# Altium schematic sheet Power.SchDoc
size A4; SheetNumber: 3; SheetTotal: 3
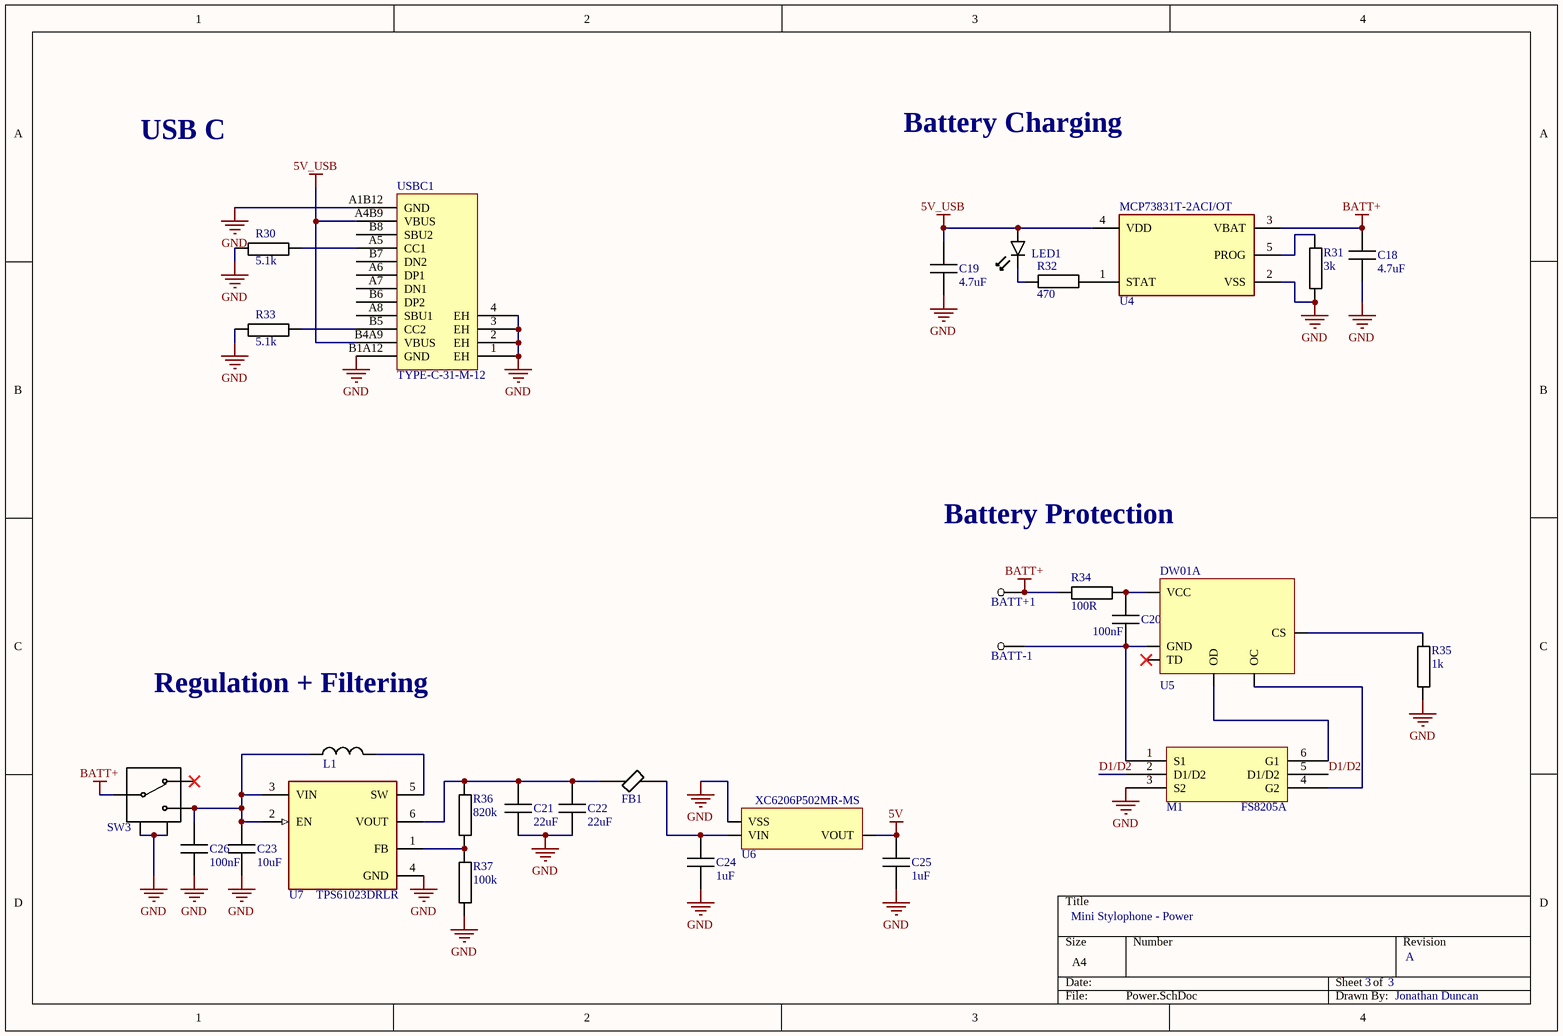
[diagram p0: Power.SchDoc]

## Parts
BATT+1  THT 100mil pad  [THT 100mil pad-Footprint-1]  (value not drawn)  (no BOM)
BATT-1  THT 100mil pad  [THT 100mil pad-Footprint-1]  (value not drawn)  (no BOM)
C18  value 4.7uF  [FP-CC0603-DA-IPC_B]  (hidden comment: Cap 4.7uF 0603)
C19  value 4.7uF  [FP-CC0603-DA-IPC_B]  (hidden comment: Cap 4.7uF 0603)
C20  value 100nF  [FP-CC0603-DA-IPC_B]  (hidden comment: Cap 100nF 0603)
C21  value 22uF  [FP-CC0603-DA-IPC_B]  (hidden comment: Cap 22uF 0603)
C22  value 22uF  [FP-CC0603-DA-IPC_B]  (hidden comment: Cap 22uF 0603)
C23  value 10uF  [FP-CC0603-DA-IPC_B]  (hidden comment: Cap 10uF 0603)
C24  value 1uF  [FP-CC0603-DA-IPC_B]  (hidden comment: Cap 1uF 0603)
C25  value 1uF  [FP-CC0603-DA-IPC_B]  (hidden comment: Cap 1uF 0603)
C26  value 100nF  [FP-CC0603-DA-IPC_B]  (hidden comment: Cap 100nF 0603)
FB1  BLM21AG601SN1D  [FP-BLM21-0_2-t0_85-e0_5-IPC_B]  (value not drawn)
L1  FWP252012P-1R0ML  [INDC2520X120N]  (value not drawn)
LED1  XL-1608SURC-06  [DIOC1608X60N]  (value not drawn)
M1  FS8205A  [SOT95P280X125-6N]
R30  value 5.1k  [FP-RC0603-0_55-IPC_B]  (hidden comment: Res 5k1 0603)
R31  value 3k  [FP-RC0603-0_55-IPC_B]  (hidden comment: Res 3k 0603)
R32  value 470  [FP-RC0603-0_55-IPC_B]  (hidden comment: Res 470 0603)
R33  value 5.1k  [FP-RC0603-0_55-IPC_B]  (hidden comment: Res 5k1 0603)
R34  value 100R  [FP-RC0603-0_55-IPC_B]  (hidden comment: Res 100R 0603)
R35  value 1k  [FP-RC0603-0_55-IPC_B]  (hidden comment: Res 1k 0603)
R36  value 820k  [FP-RC0603-0_55-IPC_B]  (hidden comment: Res 820k 0603)
R37  value 100k  [FP-RC0603-0_55-IPC_B]  (hidden comment: Res 100k 0603)
SW3  SS12D07VG4 087  [SS12D07VG4 087-Footprint-1]  (value not drawn)
U4  MCP73831T-2ACI/OT  [FP-C04-091-OT-IPC_B]
U5  DW01A  [SOT95P280X120-6N]
U6  XC6206P502MR-MS  [SOT95P240X115-3N]
U7  TPS61023DRLR  [FP-DRL0006A-MFG]
USBC1  TYPE-C-31-M-12  [TYPE-C-31-M-12-Footprint-1]

## Nets
5V: C25.2 U6.3(VOUT)
5V_USB: C19.2 LED1.2 U4.4(VDD) USBC1.A4B9(VBUS) USBC1.B4A9(VBUS)
BATT+: BATT+1.1 C18.2 R34.1 SW3.2 U4.3(VBAT)
GND: C18.1 C19.1 C21.1 C22.1 C23.1 C24.1 C25.1 C26.1 M1.3(S2) R30.1 R31.1 R33.1 R35.1 R37.1 SW3.4 SW3.5 U4.2(VSS) U6.1(VSS) U7.4(GND) USBC1.1(EH) USBC1.2(EH) USBC1.3(EH) USBC1.4(EH) USBC1.A1B12(GND) USBC1.B1A12(GND)
D1/D2: M1.2(D1/D2) M1.5(D1/D2)
NetBATT-1_1: BATT-1.1 C20.1 M1.1(S1) U5.6(GND)
NetC20_2: C20.2 R34.2 U5.5(VCC)
NetC21_2: C21.2 C22.2 FB1.1 R36.2 U7.6(VOUT)
NetC23_2: C23.2 C26.2 L1.1 SW3.3 U7.2(EN) U7.3(VIN)
NetC24_2: C24.2 FB1.2 U6.2(VIN)
NetL1_2: L1.2 U7.5(SW)
NetLED1_1: LED1.1 R32.2
NetM1_4: M1.4(G2) U5.3(OC)
NetM1_6: M1.6(G1) U5.1(OD)
NetR30_2: R30.2 USBC1.A5(CC1)
NetR31_2: R31.2 U4.5(PROG)
NetR32_1: R32.1 U4.1(STAT)
NetR33_2: R33.2 USBC1.B5(CC2)
NetR35_2: R35.2 U5.2(CS)
NetR36_1: R36.1 R37.2 U7.1(FB)

Not connected (* = marked no-connect by the designer): SW3 1*; U5 4(TD)*; USBC1 A6(DP1) A7(DN1) A8(SBU1) B6(DP2) B7(DN2) B8(SBU2)

## Notes on the sheet
- USB C
- Battery Charging
- Battery Protection
- Regulation + Filtering
- Mini Stylophone - Power
- 3
- A
- Jonathan Duncan

## Library data of the parts
BATT+1 BATT-1 = CMP-00020-1: 40mil hole, 100mil pad THT; Hole Diameter: 40mil; Pad Diameter: 100mil
C18 C19 = CMP-001-00004-1: 4.7uF 16V 10% X5R 0603 SMD Capacitor; Voltage Rating: 16V; Tolerance: 10%; Temperature Coefficient: X5R; Mounting Technology: SMT; Case/Package: 0603
C20 C26 = CMP-00006-5: 100nF 50V 10% X7R 0603 SMD Capacitor Decoupling; Temperature Coefficient: X7R; Mounting Technology: SMT; Tolerance: 10%; Case/Package: 0603; Voltage Rating: 50V
C21 C22 = CMP-001-00003-1: 22uF 6.3V 20% X5R 0603 SMD Capacitor; Case/Package: 0603; Mounting Technology: SMT; Voltage Rating: 6.3V; Tolerance: 20%; Temperature Coefficient: X5R
C23 = CMP-001-00002-1: 10uF 6.3V 10% X5R 0603 SMD Capacitor; Mounting Technology: SMT; Voltage Rating: 6.3V; Case/Package: 0603; Tolerance: 10%; Temperature Coefficient: X5R
C24 C25 = CMP-001-00001-2: 1uF 25V 10% X5R 0603 SMD Capacitor; Temperature Coefficient: X5R; Case/Package: 0603; Voltage Rating: 25V; Tolerance: 10%; Mounting Technology: SMT
FB1 = CMP-00030-2: Ferrite Beads Multi-Layer 600Ohm 25% 100MHz 600mA 210mOhm DCR 0805 T/R; Impedance: 600Ω; Case/Package: 0805; Case Code (Imperial): 0805
L1 = CMP-00031-3: 1MHz ¡À20% 41m¦¸ 3.5A 1¦ÌH 1008 2.5mm(Length)*1.2mm(height)
LED1 = CMP-00029-2: 120¡ã 330mcd 1.6*0.8*0.6 mm colourless£¬red£¬transparent 0603
M1 = CMP-00026-3: 1.5W 10V 1.2V 5.7NC@ 10V 1INDIVIDUALNCHANNEL 20V 19.5M¦¸@ 4.5V, 3A 6A 466PF@10V SOT-23-6
R30 R33 = CMP-009-00005-1: 5.1k 1% 100mW 0603 SMD Resistor; Power Rating: 100mW; Mounting Technology: SMT; Tolerance: 1%; Case/Package: 0603
R31 = CMP-009-00025-1: 3k 1% 100mW 0603 SMD Resistor; Tolerance: 1%; Mounting Technology: SMT; Power Rating: 100mW; Case/Package: 0603
R32 = CMP-00011-2: 470 1% 100mW 0603 SMD Resistor; Case/Package: 0603; Power Rating: 100mW; Tolerance: 1%; Mounting Technology: SMT
R34 = CMP-009-00020-1: 100R 1% 100mW 0603 SMD Resistor; Case/Package: 0603; Tolerance: 1%; Mounting Technology: SMT; Power Rating: 100mW
R35 = CMP-009-00023-1: 1k 1% 100mW 0603 SMD Resistor; Tolerance: 1%; Power Rating: 100mW; Mounting Technology: SMT; Case/Package: 0603
R36 = CMP-009-00024-1: 820k 1% 100mW 0603 SMD Resistor; Case/Package: 0603; Tolerance: 1%; Power Rating: 100mW; Mounting Technology: SMT
R37 = CMP-009-00003-1: 100k 1% 100mW 0603 SMD Resistor; Power Rating: 100mW; Case/Package: 0603; Mounting Technology: SMT; Tolerance: 1%
SW3 = CMP-002-000001-2: Direct Insert 500mA Single Pole Double Throw (SPDT) 50V 5 Thousand Times Plugin Slide Switches ROHS
U4 = CMP-00024-2: MCP73831 Series Single-Cell Li-Ion/Li-Polymer Battery Charge Controller SOT-23-5; Case/Package: SOT-23
U5 = CMP-00025-3: Battery management
U6 = CMP-00028-1: SOT-23, : : : 8V : 5.0V : 250mA (PSRR): 40dB@(1kHz), 2.5%, (IoT).
U7 = CMP-00027-1: Switching Voltage Regulators 3.7-A boost converter with 0.5-V ultra-low input vo
USBC1 = CMP-00002-5: USB Type-C Connector Female SMD 16 pin; Current Rating: 5A; Gender: Female; Mounting Technology: SMT